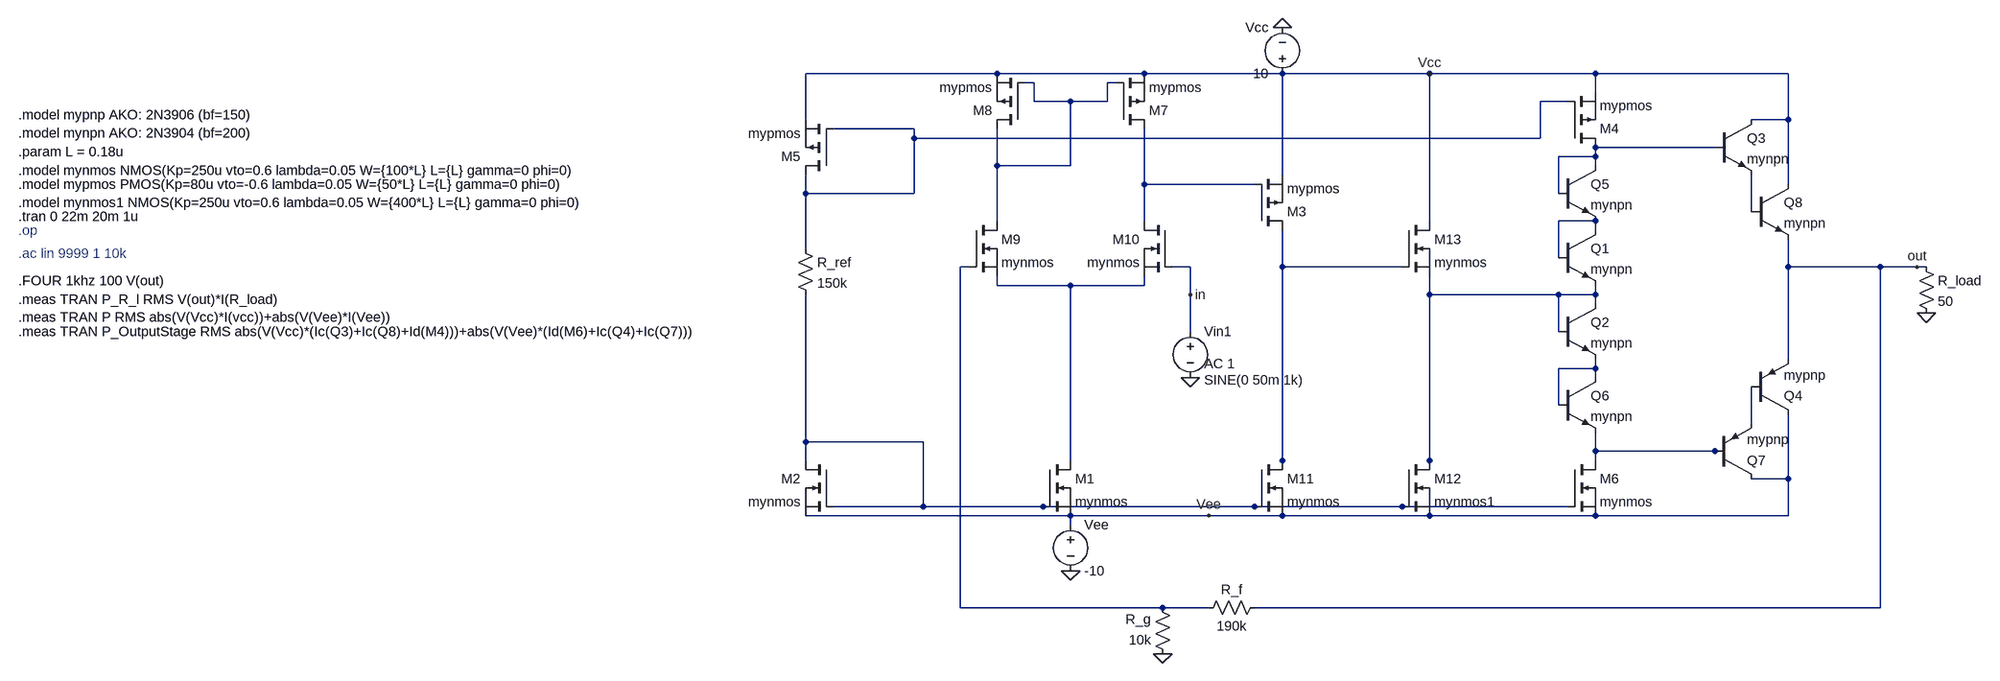
[diagram p0: schematic amplifier.asc]
amplifier.asc, the LTspice schematic file:
Version 4.1
SHEET 1 1720 976
WIRE -304 -352 -640 -352
WIRE -48 -352 -304 -352
WIRE 192 -352 -48 -352
WIRE 448 -352 192 -352
WIRE 736 -352 448 -352
WIRE 1088 -352 736 -352
WIRE -240 -336 -256 -336
WIRE -96 -336 -112 -336
WIRE 736 -320 736 -352
WIRE -240 -304 -240 -336
WIRE -176 -304 -240 -304
WIRE -112 -304 -112 -336
WIRE -112 -304 -176 -304
WIRE 688 -304 640 -304
WIRE -640 -272 -640 -352
WIRE 1088 -272 1088 -352
WIRE 1088 -272 1024 -272
WIRE -448 -256 -592 -256
WIRE -448 -240 -448 -256
WIRE 640 -240 640 -304
WIRE 640 -240 -448 -240
WIRE 736 -224 736 -240
WIRE 960 -224 736 -224
WIRE 736 -208 736 -224
WIRE 736 -208 672 -208
WIRE -304 -192 -304 -256
WIRE -176 -192 -176 -304
WIRE -176 -192 -304 -192
WIRE 736 -192 736 -208
WIRE 192 -176 192 -352
WIRE -48 -160 -48 -256
WIRE 144 -160 -48 -160
WIRE 1088 -160 1088 -272
WIRE -640 -144 -640 -176
WIRE -448 -144 -448 -240
WIRE -448 -144 -640 -144
WIRE 672 -144 672 -208
WIRE 1024 -112 1024 -176
WIRE -304 -96 -304 -192
WIRE -48 -96 -48 -160
WIRE 448 -96 448 -352
WIRE 736 -96 672 -96
WIRE 736 -80 736 -96
WIRE -640 -48 -640 -144
WIRE 672 -32 672 -96
WIRE -352 -16 -368 -16
WIRE 32 -16 0 -16
WIRE 192 -16 192 -80
WIRE 400 -16 192 -16
WIRE 1088 -16 1088 -64
WIRE 1248 -16 1088 -16
WIRE 1312 -16 1248 -16
WIRE 1328 -16 1312 -16
WIRE -304 16 -304 0
WIRE -176 16 -304 16
WIRE -48 16 -48 0
WIRE -48 16 -176 16
WIRE 32 32 32 -16
WIRE 448 32 448 0
WIRE 672 32 448 32
WIRE 736 32 736 16
WIRE 736 32 672 32
WIRE 736 48 736 32
WIRE 32 96 32 32
WIRE 672 96 672 32
WIRE 1088 144 1088 -16
WIRE 736 160 736 144
WIRE 736 160 672 160
WIRE 736 176 736 160
WIRE 672 224 672 160
WIRE 1024 256 1024 192
WIRE -640 288 -640 32
WIRE -432 288 -640 288
WIRE 736 304 736 272
WIRE 960 304 736 304
WIRE 976 304 960 304
WIRE -640 320 -640 288
WIRE -176 320 -176 16
WIRE 192 320 192 -16
WIRE 448 320 448 32
WIRE 736 320 736 304
WIRE 192 336 192 320
WIRE 448 336 448 320
WIRE 1088 352 1088 240
WIRE 1088 352 1024 352
WIRE -432 400 -432 288
WIRE -432 400 -592 400
WIRE -224 400 -432 400
WIRE 144 400 -224 400
WIRE 400 400 144 400
WIRE 688 400 400 400
WIRE -176 416 -640 416
WIRE 64 416 -176 416
WIRE 192 416 64 416
WIRE 448 416 192 416
WIRE 736 416 736 400
WIRE 736 416 448 416
WIRE 1088 416 1088 352
WIRE 1088 416 736 416
WIRE -176 432 -176 416
WIRE -368 576 -368 -16
WIRE -16 576 -368 576
WIRE 64 576 -16 576
WIRE 1248 576 1248 -16
WIRE 1248 576 144 576
FLAG -176 512 0
FLAG 32 176 0
FLAG 32 32 in
FLAG 1328 64 0
FLAG -16 656 0
FLAG 1312 -16 out
FLAG 192 -432 0
FLAG 64 416 Vee
FLAG 448 -352 Vcc
DATAFLAG -176 16 ""
DATAFLAG -432 400 ""
DATAFLAG -640 288 ""
DATAFLAG 1184 -16 ""
SYMBOL voltage -176 416 R0
SYMATTR InstName Vee
SYMATTR Value -10
SYMBOL res -656 -64 R0
SYMATTR InstName R_ref
SYMATTR Value 150k
SYMBOL nmos -224 320 R0
SYMATTR InstName M1
SYMATTR Value mynmos
SYMBOL nmos -592 320 M0
SYMATTR InstName M2
SYMATTR Value mynmos
SYMBOL voltage 32 80 R0
WINDOW 3 24 100 Left 2
WINDOW 123 24 72 Left 2
WINDOW 39 0 0 Left 0
SYMATTR Value SINE(0 50m 1k)
SYMATTR Value2 AC 1
SYMATTR InstName Vin1
SYMBOL npn 672 -80 R0
SYMATTR InstName Q1
SYMATTR Value mynpn
SYMBOL npn 672 48 R0
SYMATTR InstName Q2
SYMATTR Value mynpn
SYMBOL npn 960 -272 R0
SYMATTR InstName Q3
SYMATTR Value mynpn
SYMBOL pnp 1024 240 M180
SYMATTR InstName Q4
SYMATTR Value mypnp
SYMBOL res 1312 -32 R0
SYMATTR InstName R_load
SYMATTR Value 50
SYMBOL pmos 144 -80 M180
SYMATTR InstName M3
SYMATTR Value mypmos
SYMBOL pmos 688 -224 M180
SYMATTR InstName M4
SYMATTR Value mypmos
SYMBOL pmos -592 -176 R180
SYMATTR InstName M5
SYMATTR Value mypmos
SYMBOL nmos 688 320 R0
SYMATTR InstName M6
SYMATTR Value mynmos
SYMBOL pmos -96 -256 M180
SYMATTR InstName M7
SYMATTR Value mypmos
SYMBOL pmos -256 -256 R180
SYMATTR InstName M8
SYMATTR Value mypmos
SYMBOL nmos -352 -96 R0
SYMATTR InstName M9
SYMATTR Value mynmos
SYMBOL nmos 0 -96 M0
SYMATTR InstName M10
SYMATTR Value mynmos
SYMBOL npn 672 -192 R0
SYMATTR InstName Q5
SYMATTR Value mynpn
SYMBOL npn 672 176 R0
SYMATTR InstName Q6
SYMATTR Value mynpn
SYMBOL pnp 960 352 M180
SYMATTR InstName Q7
SYMATTR Value mypnp
SYMBOL npn 1024 -160 R0
SYMATTR InstName Q8
SYMATTR Value mynpn
SYMBOL res 160 560 R90
WINDOW 0 0 56 VBottom 2
WINDOW 3 32 56 VTop 2
SYMATTR InstName R_f
SYMATTR Value 190k
SYMBOL res 0 672 R180
WINDOW 0 36 76 Left 2
WINDOW 3 36 40 Left 2
SYMATTR InstName R_g
SYMATTR Value 10k
SYMBOL nmos 144 320 R0
SYMATTR InstName M11
SYMATTR Value mynmos
SYMBOL nmos 400 320 R0
SYMATTR InstName M12
SYMATTR Value mynmos1
SYMBOL nmos 400 -96 R0
SYMATTR InstName M13
SYMATTR Value mynmos
SYMBOL voltage 192 -336 R180
WINDOW 0 24 96 Left 2
WINDOW 3 24 16 Left 2
SYMATTR InstName Vcc
SYMATTR Value 10
TEXT -2008 -104 Left 2 !.tran 0 22m 20m 1u
TEXT -2008 -216 Left 2 !.param L = 0.18u
TEXT -2008 -184 Left 2 !.model mynmos NMOS(Kp=250u vto=0.6 lambda=0.05 W={100*L} L={L} gamma=0 phi=0)
TEXT -2008 -160 Left 2 !.model mypmos PMOS(Kp=80u vto=-0.6 lambda=0.05 W={50*L} L={L} gamma=0 phi=0)
TEXT -2008 -280 Left 2 !.model mypnp AKO: 2N3906 (bf=150)\n.model mynpn AKO: 2N3904 (bf=200)
TEXT -2008 -128 Left 2 !.model mynmos1 NMOS(Kp=250u vto=0.6 lambda=0.05 W={400*L} L={L} gamma=0 phi=0)
TEXT -2008 -80 Left 2 ;.op
TEXT -2008 40 Left 2 !.meas TRAN P_R_l RMS V(out)*I(R_load)\n.meas TRAN P RMS abs(V(Vcc)*I(vcc))+abs(V(Vee)*I(Vee))
TEXT -2008 -40 Left 2 ;.ac lin 9999 1 10k
TEXT -2008 8 Left 2 !.FOUR 1khz 100 V(out)
TEXT -2008 96 Left 2 !.meas TRAN P_OutputStage RMS abs(V(Vcc)*(Ic(Q3)+Ic(Q8)+Id(M4)))+abs(V(Vee)*(Id(M6)+Ic(Q4)+Ic(Q7)))

The netlist it stands for:
* amplifier.asc
Vee Vee 0 -10
R_ref N002 N013 150k
M1 N009 N013 Vee Vee mynmos
M2 N013 N013 Vee Vee mynmos
Vin1 in 0 SINE(0 50m 1k) AC 1
Q1 N006 N006 N010 0 mynpn
Q2 N010 N010 N011 0 mynpn
Q3 Vcc N003 N005 0 mynpn
Q4 Vee N012 out 0 mypnp
R_load out 0 50
M3 N008 N004 Vcc Vcc mypmos
M4 N003 N002 Vcc Vcc mypmos
M5 N002 N002 Vcc Vcc mypmos
M6 N014 N013 Vee Vee mynmos
M7 N004 N001 Vcc Vcc mypmos
M8 N001 N001 Vcc Vcc mypmos
M9 N001 N007 N009 N009 mynmos
M10 N004 in N009 N009 mynmos
Q5 N003 N003 N006 0 mynpn
Q6 N011 N011 N014 0 mynpn
Q7 Vee N014 N012 0 mypnp
Q8 Vcc N005 out 0 mynpn
R_f out N007 190k
R_g 0 N007 10k
M11 N008 N013 Vee Vee mynmos
M12 N010 N013 Vee Vee mynmos1
M13 Vcc N008 N010 N010 mynmos
Vcc Vcc 0 10
.model NPN NPN
.model PNP PNP
.lib standard.bjt
.model NMOS NMOS
.model PMOS PMOS
.lib standard.mos
.tran 0 22m 20m 1u
.param L = 0.18u
.model mynmos NMOS(Kp=250u vto=0.6 lambda=0.05 W={100*L} L={L} gamma=0 phi=0)
.model mypmos PMOS(Kp=80u vto=-0.6 lambda=0.05 W={50*L} L={L} gamma=0 phi=0)
.model mypnp AKO: 2N3906 (bf=150)
.model mynpn AKO: 2N3904 (bf=200)
.model mynmos1 NMOS(Kp=250u vto=0.6 lambda=0.05 W={400*L} L={L} gamma=0 phi=0)
* .op
.meas TRAN P_R_l RMS V(out)*I(R_load)
.meas TRAN P RMS abs(V(Vcc)*I(vcc))+abs(V(Vee)*I(Vee))
* .ac lin 9999 1 10k
.FOUR 1khz 100 V(out)
.meas TRAN P_OutputStage RMS abs(V(Vcc)*(Ic(Q3)+Ic(Q8)+Id(M4)))+abs(V(Vee)*(Id(M6)+Ic(Q4)+Ic(Q7)))
.backanno
.end